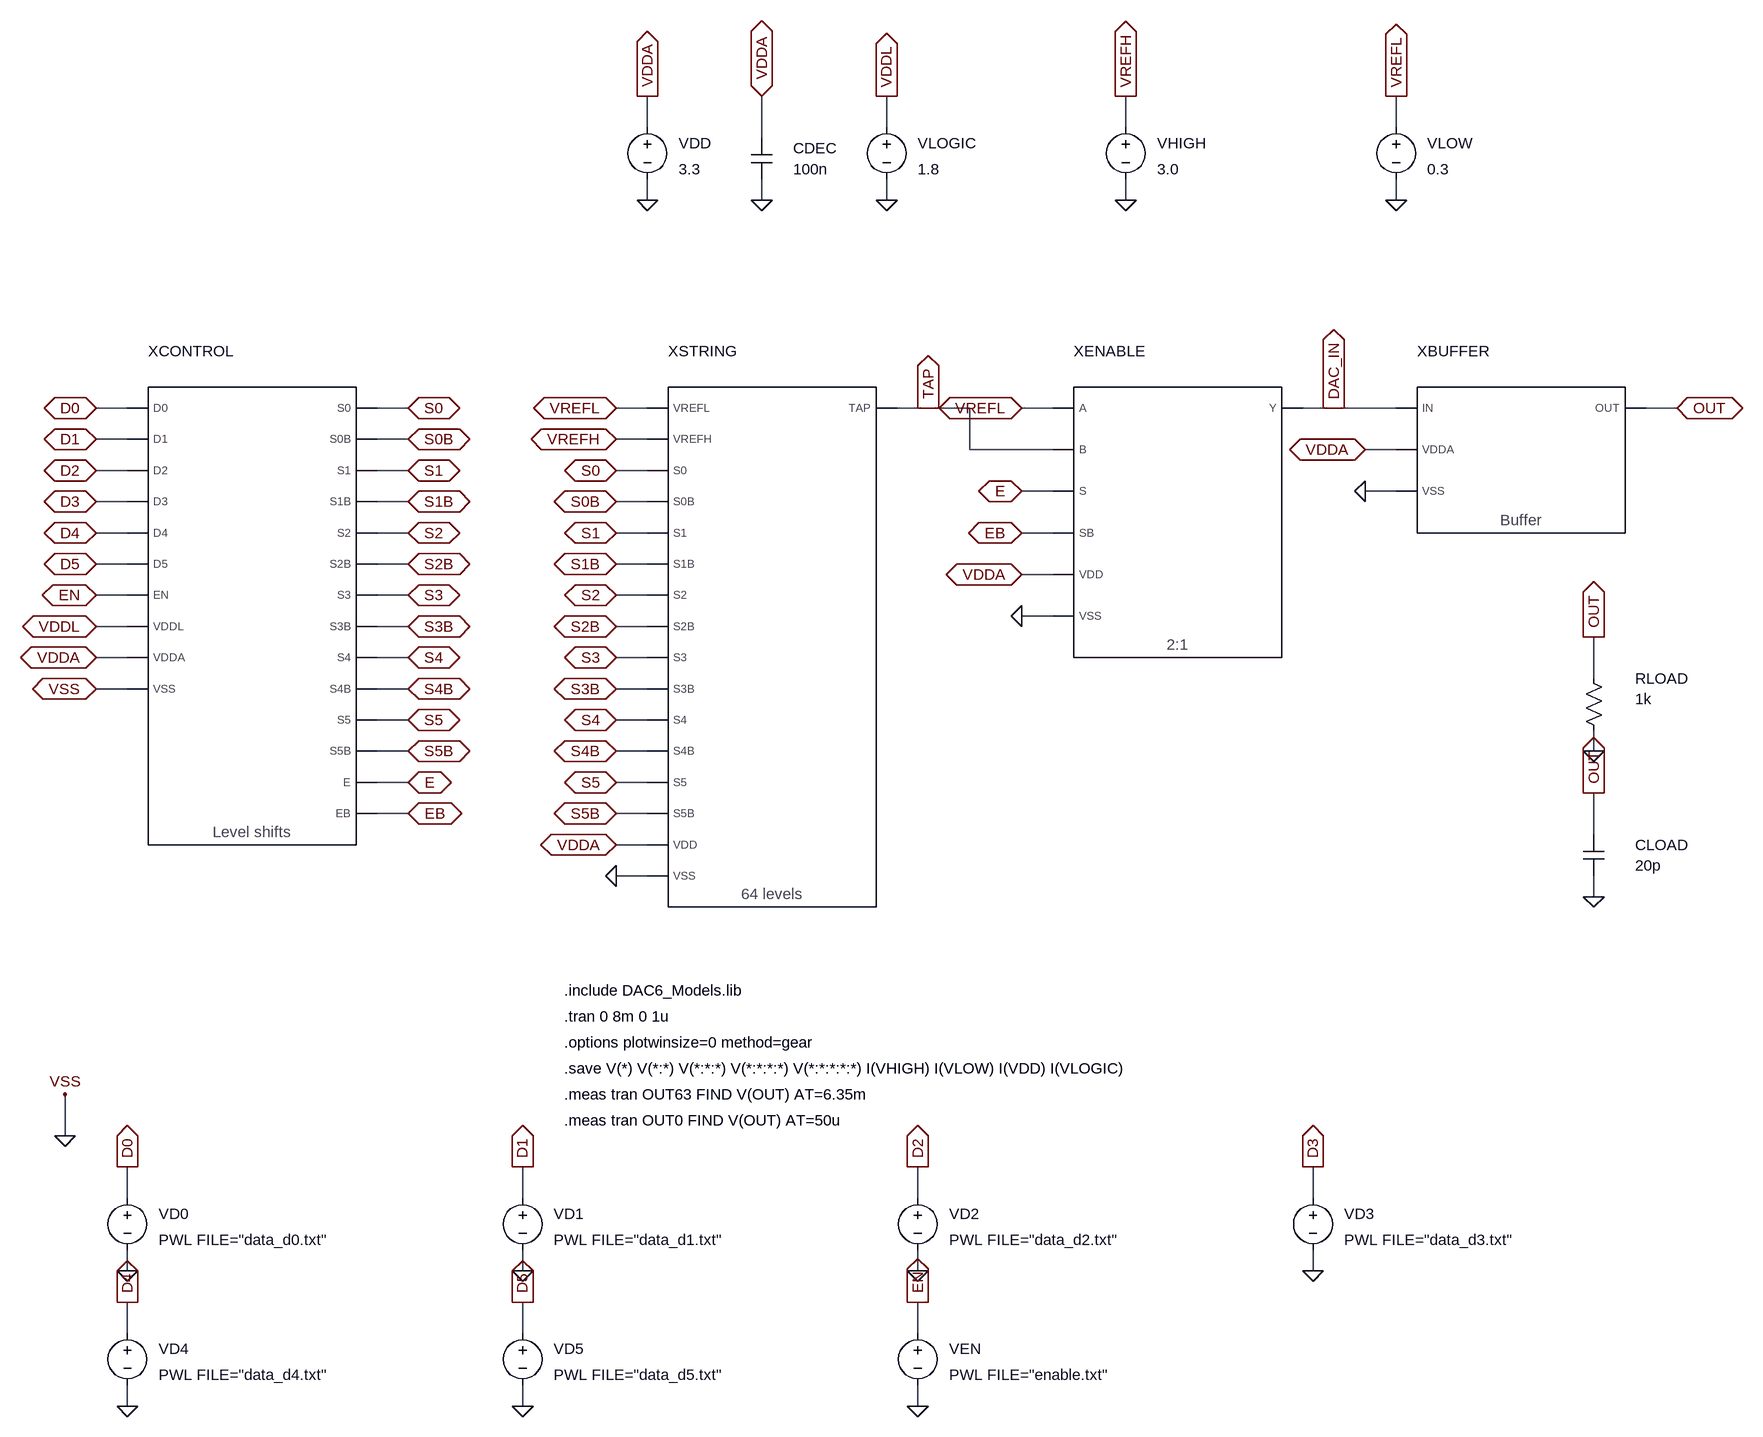
[diagram p0: schematic DAC6_Heavy_Load.asc]
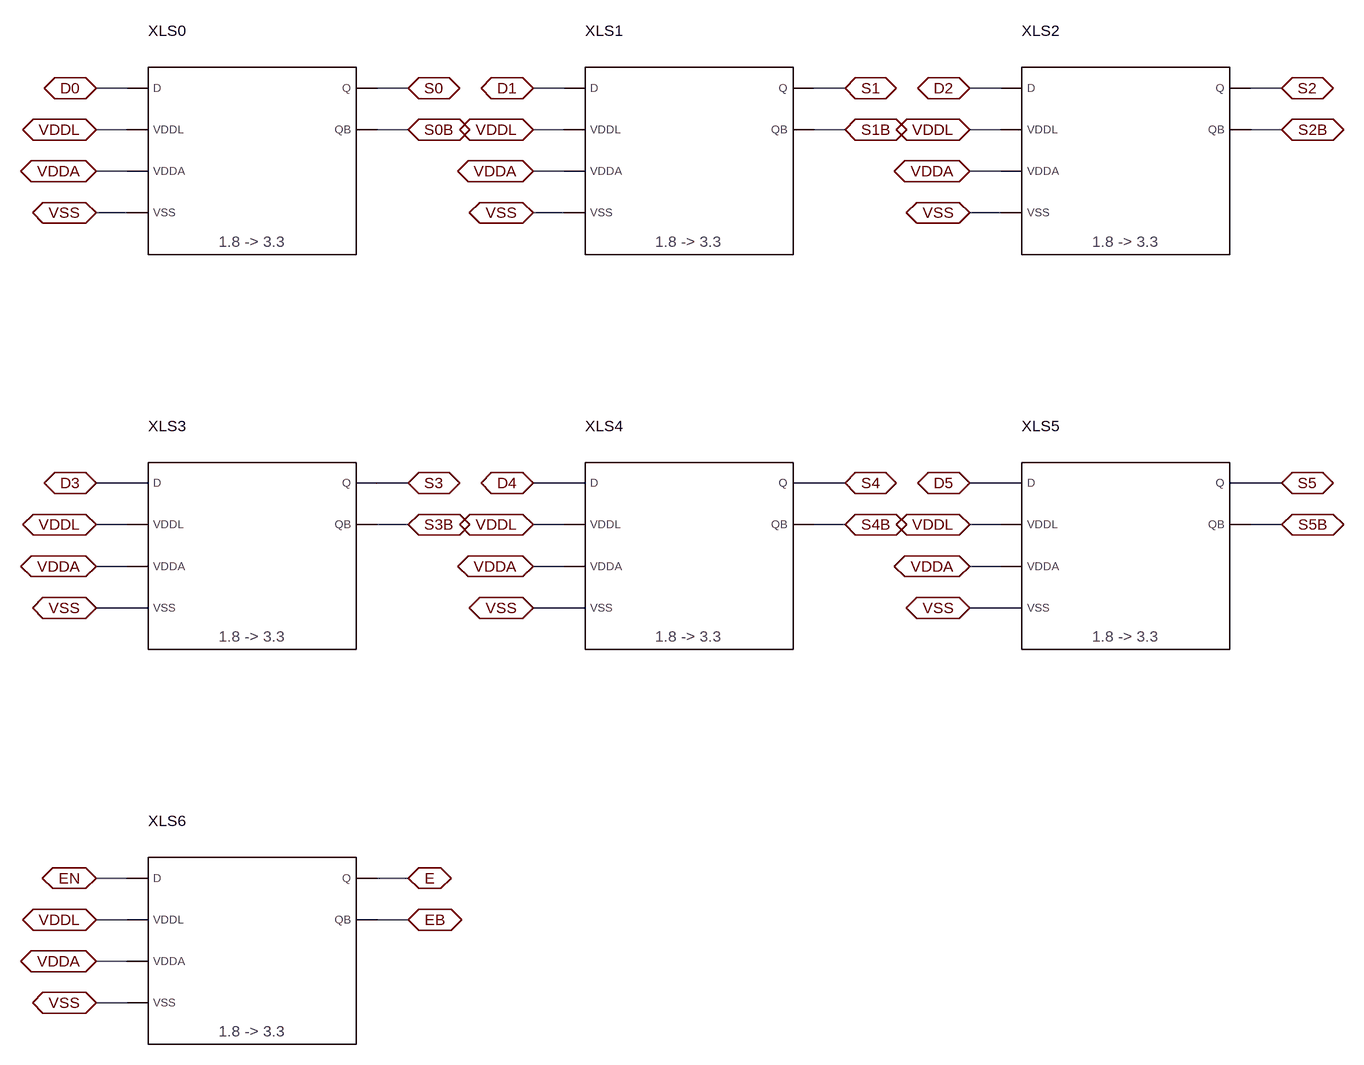
[diagram p1: sub-circuit dac_control.asc]
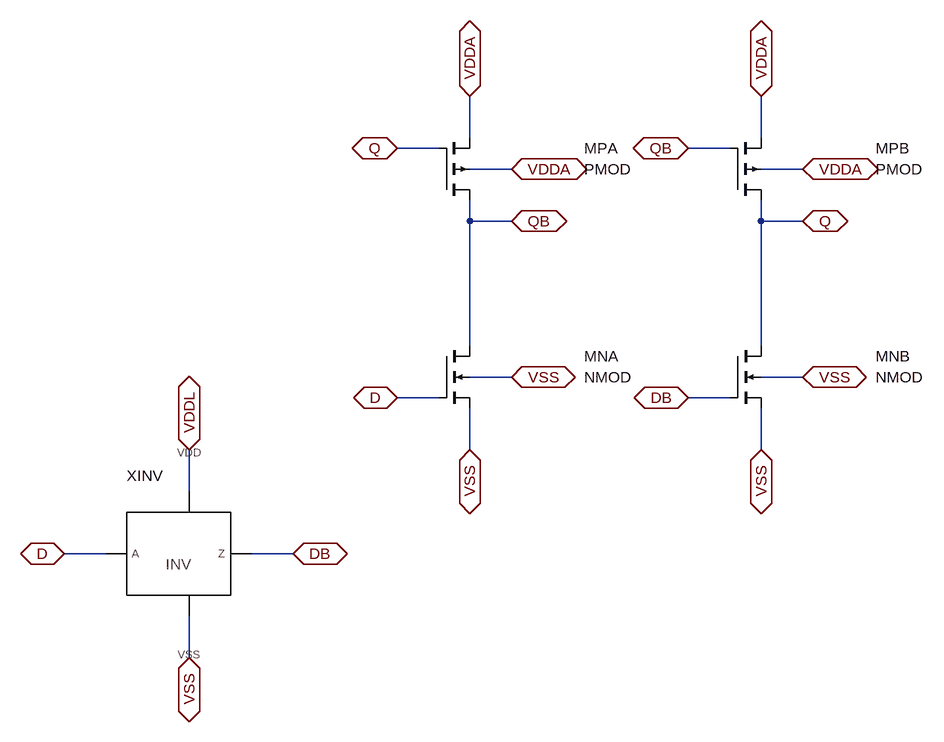
[diagram p2: sub-circuit dac_levelshift.asc]
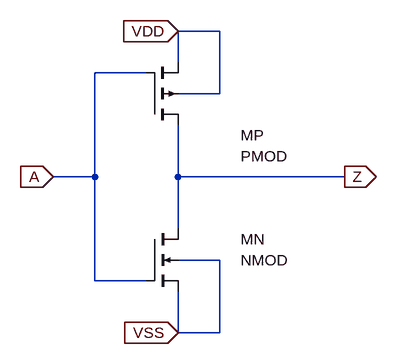
[diagram p3: sub-circuit cmos_inv.asc]
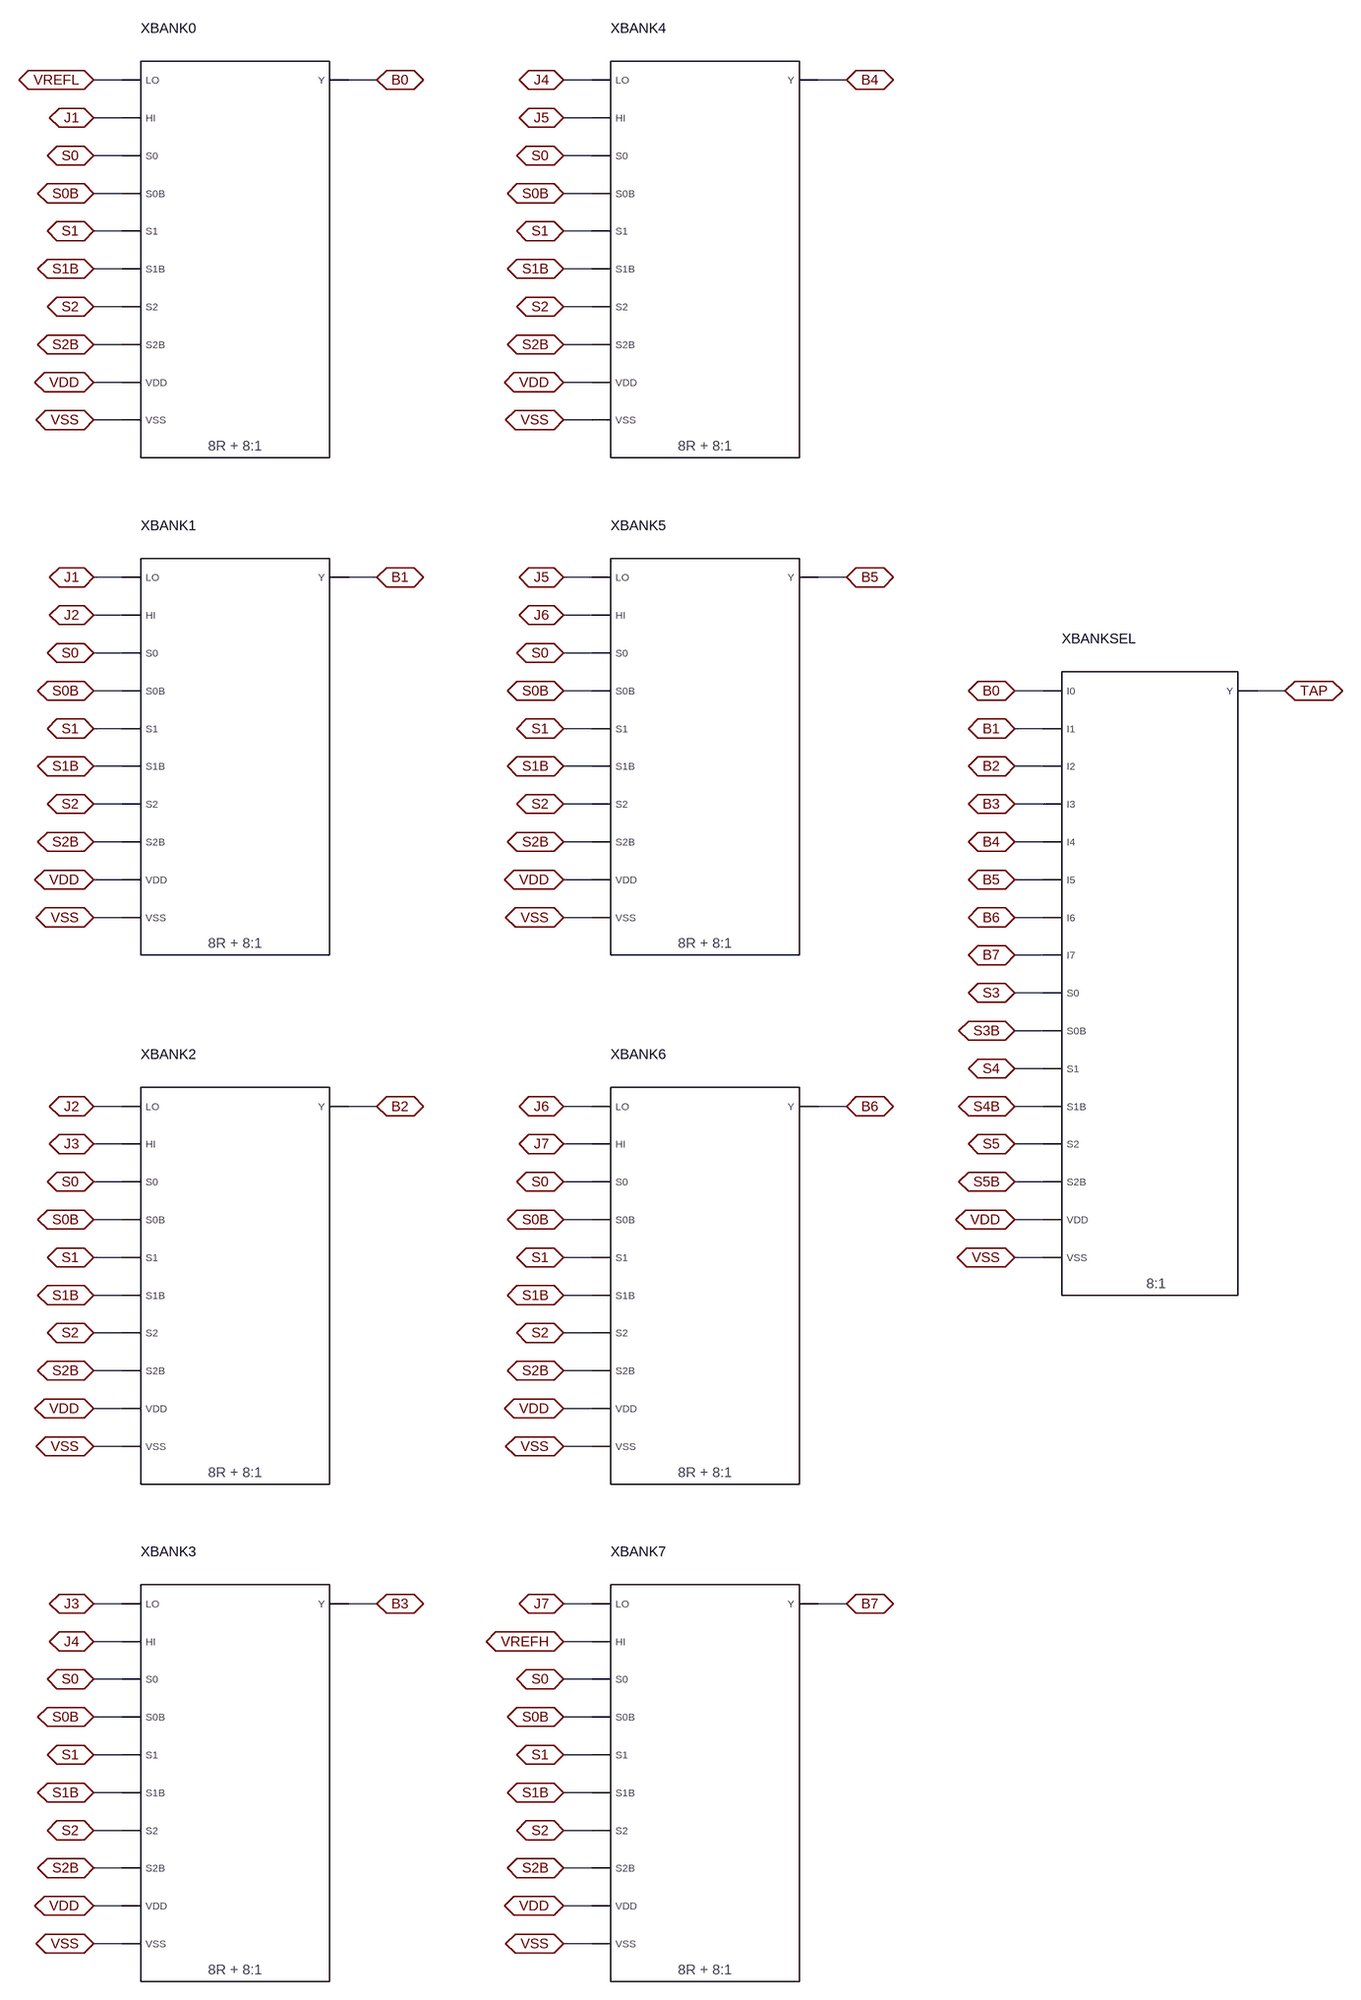
[diagram p4: sub-circuit dac_string64.asc]
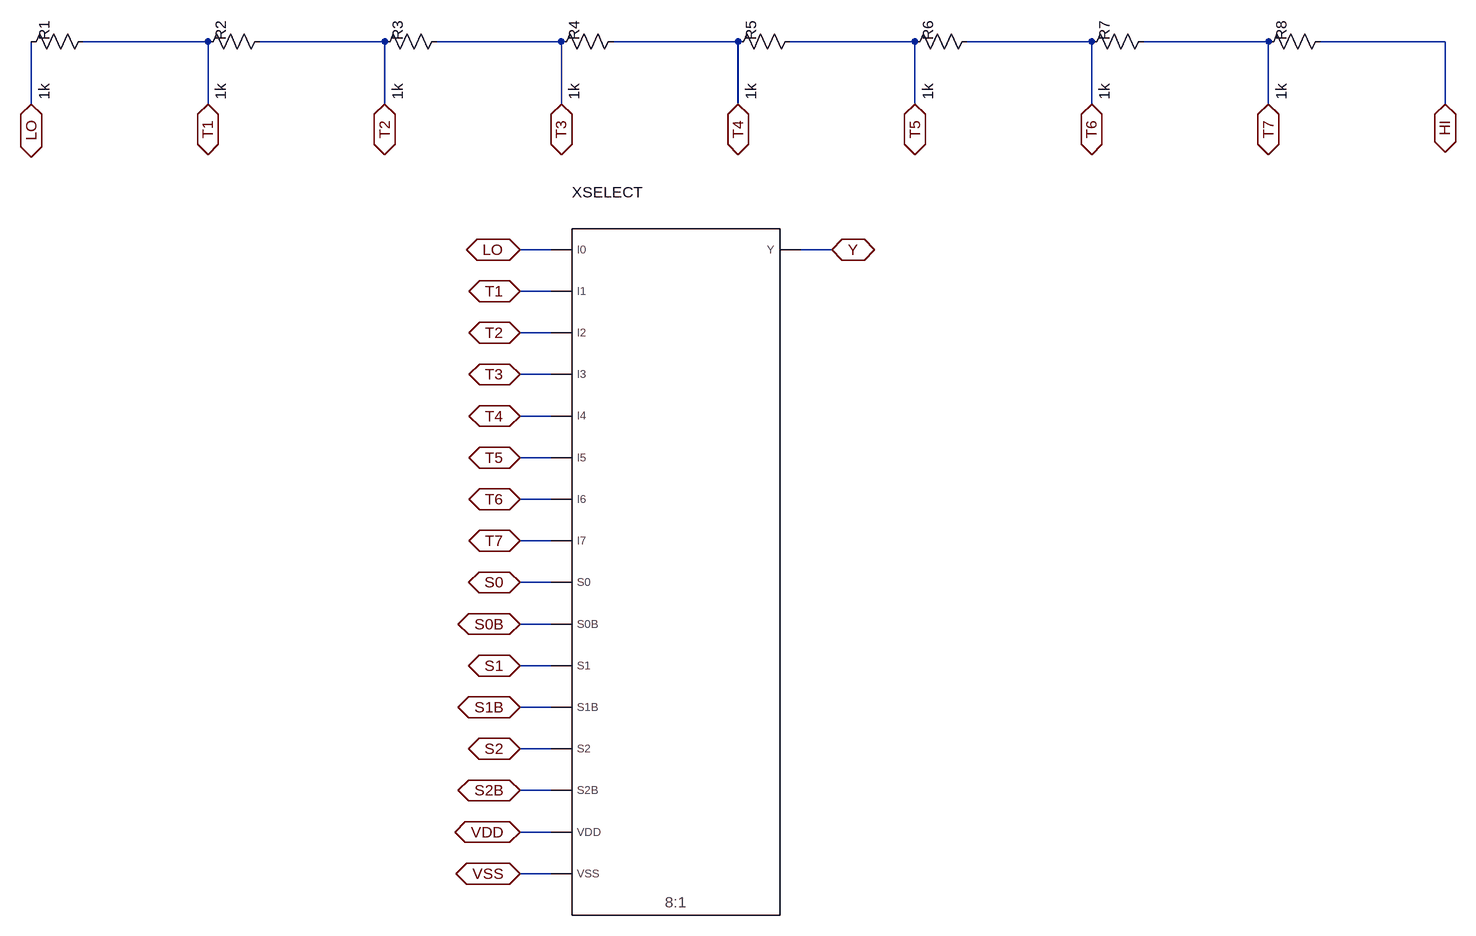
[diagram p5: sub-circuit dac_bank8.asc]
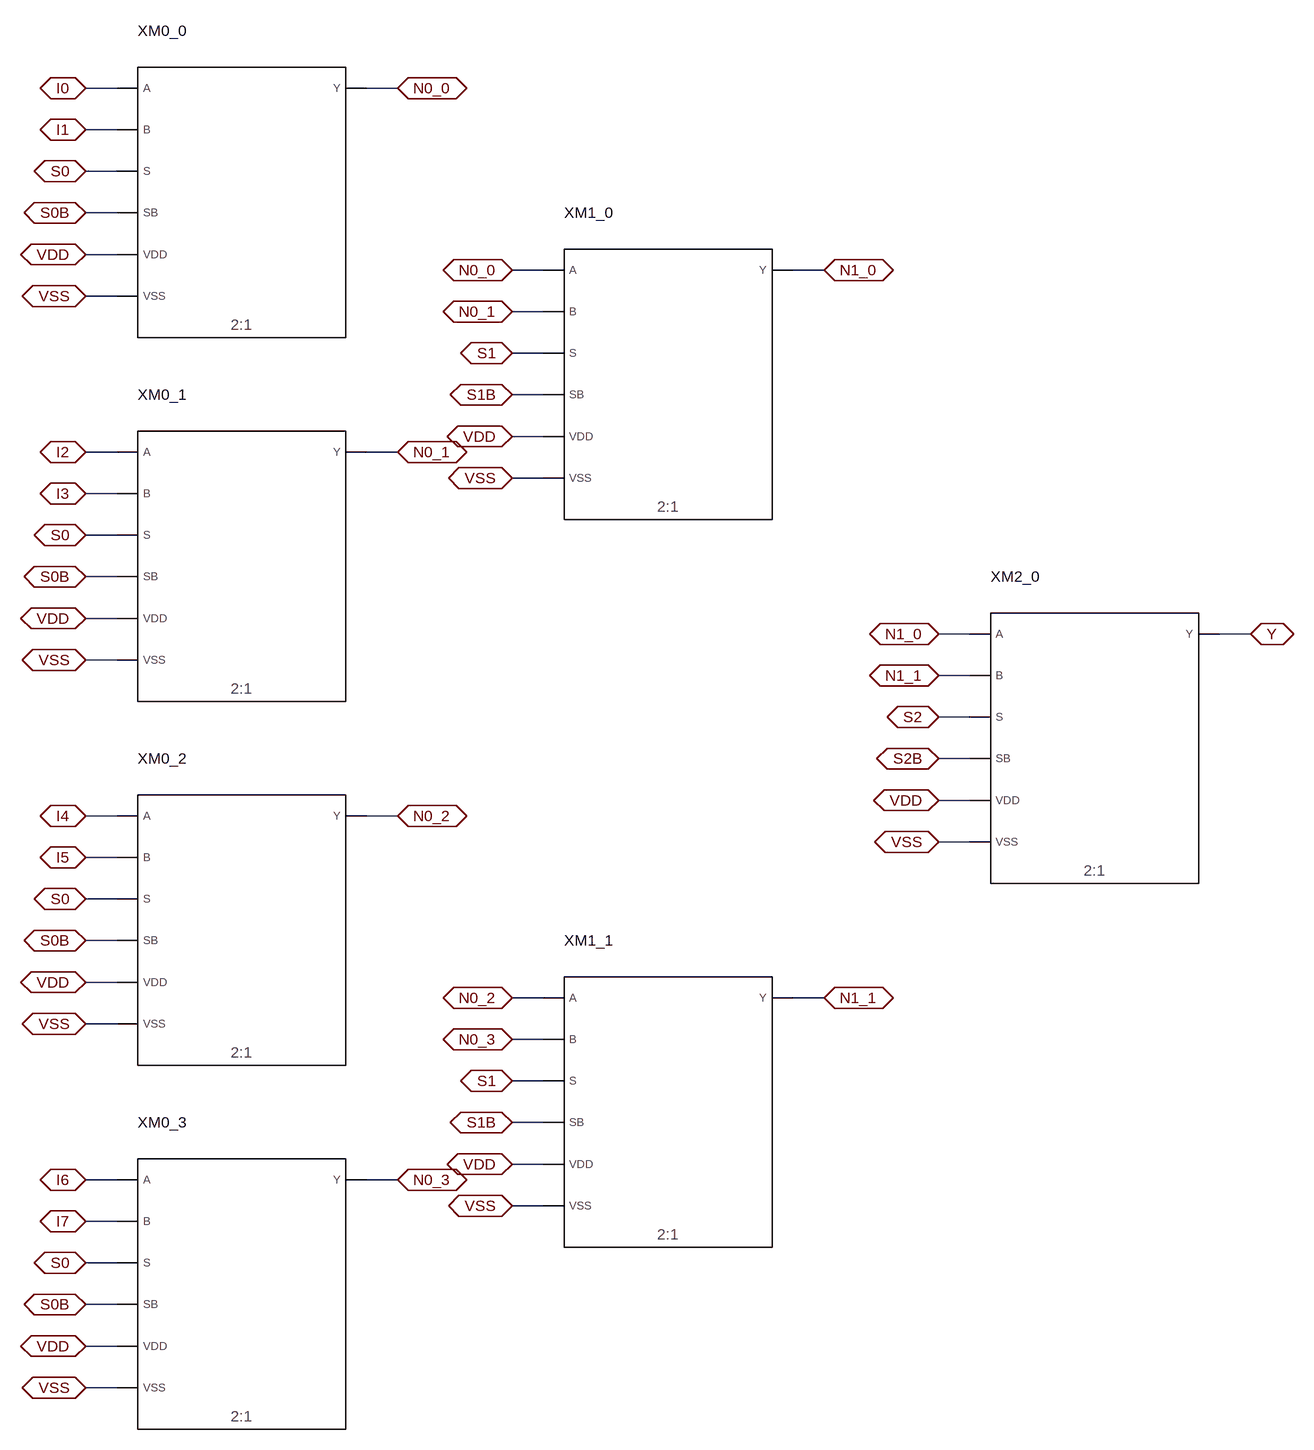
[diagram p6: sub-circuit dac_mux8.asc]
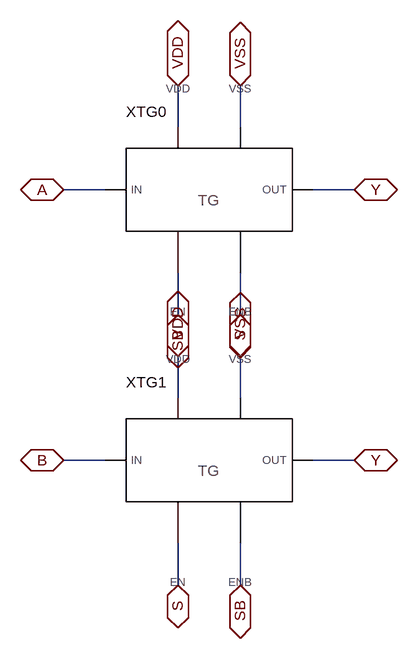
[diagram p7: sub-circuit dac_mux2.asc]
DAC6_Heavy_Load.asc, the LTspice schematic file:
Version 4.1
SHEET 1 2816 2256
WIRE 224 592 176 592
WIRE 224 640 176 640
WIRE 224 688 176 688
WIRE 224 736 176 736
WIRE 224 784 176 784
WIRE 224 832 176 832
WIRE 224 880 176 880
WIRE 224 928 176 928
WIRE 224 976 176 976
WIRE 224 1024 176 1024
WIRE 608 592 656 592
WIRE 608 640 656 640
WIRE 608 688 656 688
WIRE 608 736 656 736
WIRE 608 784 656 784
WIRE 608 832 656 832
WIRE 608 880 656 880
WIRE 608 928 656 928
WIRE 608 976 656 976
WIRE 608 1024 656 1024
WIRE 608 1072 656 1072
WIRE 608 1120 656 1120
WIRE 608 1168 656 1168
WIRE 608 1216 656 1216
WIRE 1024 592 976 592
WIRE 1024 640 976 640
WIRE 1024 688 976 688
WIRE 1024 736 976 736
WIRE 1024 784 976 784
WIRE 1024 832 976 832
WIRE 1024 880 976 880
WIRE 1024 928 976 928
WIRE 1024 976 976 976
WIRE 1024 1024 976 1024
WIRE 1024 1072 976 1072
WIRE 1024 1120 976 1120
WIRE 1024 1168 976 1168
WIRE 1024 1216 976 1216
WIRE 1024 1264 976 1264
WIRE 1024 1312 976 1312
WIRE 128 1648 128 1712
WIRE 1648 592 1600 592
WIRE 1648 720 1600 720
WIRE 1648 784 1600 784
WIRE 1648 848 1600 848
WIRE 1648 912 1600 912
WIRE 2176 656 2128 656
WIRE 2176 720 2128 720
WIRE 2560 592 2608 592
WIRE 1408 592 1520 592
WIRE 1520 592 1520 656
WIRE 1520 656 1648 656
WIRE 2032 592 2176 592
WIRE 1024 160 1024 112
WIRE 1024 240 1024 272
WIRE 1392 160 1392 112
WIRE 1392 240 1392 272
WIRE 1760 160 1760 112
WIRE 1760 240 1760 272
WIRE 2176 160 2176 112
WIRE 2176 240 2176 272
WIRE 1200 176 1200 112
WIRE 1200 240 1200 272
WIRE 224 1808 224 1760
WIRE 224 1888 224 1920
WIRE 832 1808 832 1760
WIRE 832 1888 832 1920
WIRE 1440 1808 1440 1760
WIRE 1440 1888 1440 1920
WIRE 2048 1808 2048 1760
WIRE 2048 1888 2048 1920
WIRE 224 2016 224 1968
WIRE 224 2096 224 2128
WIRE 832 2016 832 1968
WIRE 832 2096 832 2128
WIRE 1440 2016 1440 1968
WIRE 1440 2096 1440 2128
WIRE 2480 1008 2480 944
WIRE 2480 1088 2480 1120
WIRE 2480 1248 2480 1184
WIRE 2480 1312 2480 1344
FLAG 176 592 D0
IOPIN 176 592 BiDir
FLAG 176 640 D1
IOPIN 176 640 BiDir
FLAG 176 688 D2
IOPIN 176 688 BiDir
FLAG 176 736 D3
IOPIN 176 736 BiDir
FLAG 176 784 D4
IOPIN 176 784 BiDir
FLAG 176 832 D5
IOPIN 176 832 BiDir
FLAG 176 880 EN
IOPIN 176 880 BiDir
FLAG 176 928 VDDL
IOPIN 176 928 BiDir
FLAG 176 976 VDDA
IOPIN 176 976 BiDir
FLAG 176 1024 VSS
IOPIN 176 1024 BiDir
FLAG 656 592 S0
IOPIN 656 592 BiDir
FLAG 656 640 S0B
IOPIN 656 640 BiDir
FLAG 656 688 S1
IOPIN 656 688 BiDir
FLAG 656 736 S1B
IOPIN 656 736 BiDir
FLAG 656 784 S2
IOPIN 656 784 BiDir
FLAG 656 832 S2B
IOPIN 656 832 BiDir
FLAG 656 880 S3
IOPIN 656 880 BiDir
FLAG 656 928 S3B
IOPIN 656 928 BiDir
FLAG 656 976 S4
IOPIN 656 976 BiDir
FLAG 656 1024 S4B
IOPIN 656 1024 BiDir
FLAG 656 1072 S5
IOPIN 656 1072 BiDir
FLAG 656 1120 S5B
IOPIN 656 1120 BiDir
FLAG 656 1168 E
IOPIN 656 1168 BiDir
FLAG 656 1216 EB
IOPIN 656 1216 BiDir
FLAG 976 592 VREFL
IOPIN 976 592 BiDir
FLAG 976 640 VREFH
IOPIN 976 640 BiDir
FLAG 976 688 S0
IOPIN 976 688 BiDir
FLAG 976 736 S0B
IOPIN 976 736 BiDir
FLAG 976 784 S1
IOPIN 976 784 BiDir
FLAG 976 832 S1B
IOPIN 976 832 BiDir
FLAG 976 880 S2
IOPIN 976 880 BiDir
FLAG 976 928 S2B
IOPIN 976 928 BiDir
FLAG 976 976 S3
IOPIN 976 976 BiDir
FLAG 976 1024 S3B
IOPIN 976 1024 BiDir
FLAG 976 1072 S4
IOPIN 976 1072 BiDir
FLAG 976 1120 S4B
IOPIN 976 1120 BiDir
FLAG 976 1168 S5
IOPIN 976 1168 BiDir
FLAG 976 1216 S5B
IOPIN 976 1216 BiDir
FLAG 976 1264 VDDA
IOPIN 976 1264 BiDir
FLAG 976 1312 0
FLAG 128 1648 VSS
FLAG 128 1712 0
FLAG 1600 592 VREFL
IOPIN 1600 592 BiDir
FLAG 1600 720 E
IOPIN 1600 720 BiDir
FLAG 1600 784 EB
IOPIN 1600 784 BiDir
FLAG 1600 848 VDDA
IOPIN 1600 848 BiDir
FLAG 1600 912 0
FLAG 2128 656 VDDA
IOPIN 2128 656 BiDir
FLAG 2128 720 0
FLAG 2608 592 OUT
IOPIN 2608 592 BiDir
FLAG 1456 592 TAP
IOPIN 1456 592 Out
FLAG 2080 592 DAC_IN
IOPIN 2080 592 Out
FLAG 1024 112 VDDA
IOPIN 1024 112 Out
FLAG 1024 272 0
FLAG 1392 112 VDDL
IOPIN 1392 112 Out
FLAG 1392 272 0
FLAG 1760 112 VREFH
IOPIN 1760 112 Out
FLAG 1760 272 0
FLAG 2176 112 VREFL
IOPIN 2176 112 Out
FLAG 2176 272 0
FLAG 1200 112 VDDA
IOPIN 1200 112 BiDir
FLAG 1200 272 0
FLAG 224 1760 D0
IOPIN 224 1760 Out
FLAG 224 1920 0
FLAG 832 1760 D1
IOPIN 832 1760 Out
FLAG 832 1920 0
FLAG 1440 1760 D2
IOPIN 1440 1760 Out
FLAG 1440 1920 0
FLAG 2048 1760 D3
IOPIN 2048 1760 Out
FLAG 2048 1920 0
FLAG 224 1968 D4
IOPIN 224 1968 Out
FLAG 224 2128 0
FLAG 832 1968 D5
IOPIN 832 1968 Out
FLAG 832 2128 0
FLAG 1440 1968 EN
IOPIN 1440 1968 Out
FLAG 1440 2128 0
FLAG 2480 944 OUT
IOPIN 2480 944 Out
FLAG 2480 1120 0
FLAG 2480 1184 OUT
IOPIN 2480 1184 Out
FLAG 2480 1344 0
SYMBOL DAC_Control 224 528 R0
WINDOW 0 32 -24 Left 2
SYMATTR InstName XCONTROL
SYMBOL DAC_String64 1024 528 R0
WINDOW 0 32 -24 Left 2
SYMATTR InstName XSTRING
SYMBOL DAC_Mux2 1648 528 R0
WINDOW 0 32 -24 Left 2
SYMATTR InstName XENABLE
SYMBOL DAC_Buffer 2176 528 R0
WINDOW 0 32 -24 Left 2
SYMATTR InstName XBUFFER
SYMBOL voltage 1024 144 R0
WINDOW 0 48 40 Left 2
WINDOW 3 48 80 Left 2
SYMATTR InstName VDD
SYMATTR Value 3.3
SYMBOL voltage 1392 144 R0
WINDOW 0 48 40 Left 2
WINDOW 3 48 80 Left 2
SYMATTR InstName VLOGIC
SYMATTR Value 1.8
SYMBOL voltage 1760 144 R0
WINDOW 0 48 40 Left 2
WINDOW 3 48 80 Left 2
SYMATTR InstName VHIGH
SYMATTR Value 3.0
SYMBOL voltage 2176 144 R0
WINDOW 0 48 40 Left 2
WINDOW 3 48 80 Left 2
SYMATTR InstName VLOW
SYMATTR Value 0.3
SYMBOL cap 1184 176 R0
WINDOW 0 64 16 Left 2
WINDOW 3 64 48 Left 2
SYMATTR InstName CDEC
SYMATTR Value 100n
SYMBOL voltage 224 1792 R0
WINDOW 0 48 40 Left 2
WINDOW 3 48 80 Left 2
SYMATTR InstName VD0
SYMATTR Value PWL FILE="data_d0.txt"
SYMBOL voltage 832 1792 R0
WINDOW 0 48 40 Left 2
WINDOW 3 48 80 Left 2
SYMATTR InstName VD1
SYMATTR Value PWL FILE="data_d1.txt"
SYMBOL voltage 1440 1792 R0
WINDOW 0 48 40 Left 2
WINDOW 3 48 80 Left 2
SYMATTR InstName VD2
SYMATTR Value PWL FILE="data_d2.txt"
SYMBOL voltage 2048 1792 R0
WINDOW 0 48 40 Left 2
WINDOW 3 48 80 Left 2
SYMATTR InstName VD3
SYMATTR Value PWL FILE="data_d3.txt"
SYMBOL voltage 224 2000 R0
WINDOW 0 48 40 Left 2
WINDOW 3 48 80 Left 2
SYMATTR InstName VD4
SYMATTR Value PWL FILE="data_d4.txt"
SYMBOL voltage 832 2000 R0
WINDOW 0 48 40 Left 2
WINDOW 3 48 80 Left 2
SYMATTR InstName VD5
SYMATTR Value PWL FILE="data_d5.txt"
SYMBOL voltage 1440 2000 R0
WINDOW 0 48 40 Left 2
WINDOW 3 48 80 Left 2
SYMATTR InstName VEN
SYMATTR Value PWL FILE="enable.txt"
SYMBOL res 2464 992 R0
WINDOW 0 80 16 Left 2
WINDOW 3 80 48 Left 2
SYMATTR InstName RLOAD
SYMATTR Value 1k
SYMBOL cap 2464 1248 R0
WINDOW 0 80 16 Left 2
WINDOW 3 80 48 Left 2
SYMATTR InstName CLOAD
SYMATTR Value 20p
TEXT 896 1488 Left 2 !.include DAC6_Models.lib
TEXT 896 1528 Left 2 !.tran 0 8m 0 1u
TEXT 896 1568 Left 2 !.options plotwinsize=0 method=gear
TEXT 896 1608 Left 2 !.save V(*) V(*:*) V(*:*:*) V(*:*:*:*) V(*:*:*:*:*) I(VHIGH) I(VLOW) I(VDD) I(VLOGIC)
TEXT 896 1648 Left 2 !.meas tran OUT63 FIND V(OUT) AT=6.35m
TEXT 896 1688 Left 2 !.meas tran OUT0 FIND V(OUT) AT=50u

dac_control.asc, the sub-circuit schematic file:
Version 4.1
SHEET 1 2208 1952
WIRE 192 160 144 160
WIRE 192 224 144 224
WIRE 192 288 144 288
WIRE 192 352 144 352
WIRE 576 160 624 160
WIRE 576 224 624 224
WIRE 864 160 816 160
WIRE 864 224 816 224
WIRE 864 288 816 288
WIRE 864 352 816 352
WIRE 1248 160 1296 160
WIRE 1248 224 1296 224
WIRE 1536 160 1488 160
WIRE 1536 224 1488 224
WIRE 1536 288 1488 288
WIRE 1536 352 1488 352
WIRE 1920 160 1968 160
WIRE 1920 224 1968 224
WIRE 192 768 144 768
WIRE 192 832 144 832
WIRE 192 896 144 896
WIRE 192 960 144 960
WIRE 576 768 624 768
WIRE 576 832 624 832
WIRE 864 768 816 768
WIRE 864 832 816 832
WIRE 864 896 816 896
WIRE 864 960 816 960
WIRE 1248 768 1296 768
WIRE 1248 832 1296 832
WIRE 1536 768 1488 768
WIRE 1536 832 1488 832
WIRE 1536 896 1488 896
WIRE 1536 960 1488 960
WIRE 1920 768 1968 768
WIRE 1920 832 1968 832
WIRE 192 1376 144 1376
WIRE 192 1440 144 1440
WIRE 192 1504 144 1504
WIRE 192 1568 144 1568
WIRE 576 1376 624 1376
WIRE 576 1440 624 1440
FLAG 144 160 D0
IOPIN 144 160 BiDir
FLAG 144 224 VDDL
IOPIN 144 224 BiDir
FLAG 144 288 VDDA
IOPIN 144 288 BiDir
FLAG 144 352 VSS
IOPIN 144 352 BiDir
FLAG 624 160 S0
IOPIN 624 160 BiDir
FLAG 624 224 S0B
IOPIN 624 224 BiDir
FLAG 816 160 D1
IOPIN 816 160 BiDir
FLAG 816 224 VDDL
IOPIN 816 224 BiDir
FLAG 816 288 VDDA
IOPIN 816 288 BiDir
FLAG 816 352 VSS
IOPIN 816 352 BiDir
FLAG 1296 160 S1
IOPIN 1296 160 BiDir
FLAG 1296 224 S1B
IOPIN 1296 224 BiDir
FLAG 1488 160 D2
IOPIN 1488 160 BiDir
FLAG 1488 224 VDDL
IOPIN 1488 224 BiDir
FLAG 1488 288 VDDA
IOPIN 1488 288 BiDir
FLAG 1488 352 VSS
IOPIN 1488 352 BiDir
FLAG 1968 160 S2
IOPIN 1968 160 BiDir
FLAG 1968 224 S2B
IOPIN 1968 224 BiDir
FLAG 144 768 D3
IOPIN 144 768 BiDir
FLAG 144 832 VDDL
IOPIN 144 832 BiDir
FLAG 144 896 VDDA
IOPIN 144 896 BiDir
FLAG 144 960 VSS
IOPIN 144 960 BiDir
FLAG 624 768 S3
IOPIN 624 768 BiDir
FLAG 624 832 S3B
IOPIN 624 832 BiDir
FLAG 816 768 D4
IOPIN 816 768 BiDir
FLAG 816 832 VDDL
IOPIN 816 832 BiDir
FLAG 816 896 VDDA
IOPIN 816 896 BiDir
FLAG 816 960 VSS
IOPIN 816 960 BiDir
FLAG 1296 768 S4
IOPIN 1296 768 BiDir
FLAG 1296 832 S4B
IOPIN 1296 832 BiDir
FLAG 1488 768 D5
IOPIN 1488 768 BiDir
FLAG 1488 832 VDDL
IOPIN 1488 832 BiDir
FLAG 1488 896 VDDA
IOPIN 1488 896 BiDir
FLAG 1488 960 VSS
IOPIN 1488 960 BiDir
FLAG 1968 768 S5
IOPIN 1968 768 BiDir
FLAG 1968 832 S5B
IOPIN 1968 832 BiDir
FLAG 144 1376 EN
IOPIN 144 1376 BiDir
FLAG 144 1440 VDDL
IOPIN 144 1440 BiDir
FLAG 144 1504 VDDA
IOPIN 144 1504 BiDir
FLAG 144 1568 VSS
IOPIN 144 1568 BiDir
FLAG 624 1376 E
IOPIN 624 1376 BiDir
FLAG 624 1440 EB
IOPIN 624 1440 BiDir
SYMBOL DAC_LevelShift 192 96 R0
WINDOW 0 32 -24 Left 2
SYMATTR InstName XLS0
SYMBOL DAC_LevelShift 864 96 R0
WINDOW 0 32 -24 Left 2
SYMATTR InstName XLS1
SYMBOL DAC_LevelShift 1536 96 R0
WINDOW 0 32 -24 Left 2
SYMATTR InstName XLS2
SYMBOL DAC_LevelShift 192 704 R0
WINDOW 0 32 -24 Left 2
SYMATTR InstName XLS3
SYMBOL DAC_LevelShift 864 704 R0
WINDOW 0 32 -24 Left 2
SYMATTR InstName XLS4
SYMBOL DAC_LevelShift 1536 704 R0
WINDOW 0 32 -24 Left 2
SYMATTR InstName XLS5
SYMBOL DAC_LevelShift 192 1312 R0
WINDOW 0 32 -24 Left 2
SYMATTR InstName XLS6

dac_levelshift.asc, the sub-circuit schematic file:
Version 4.1
SHEET 1 1632 1136
WIRE 192 832 128 832
WIRE 416 832 480 832
WIRE 320 736 320 672
WIRE 320 928 320 992
WIRE 752 192 752 128
WIRE 752 240 816 240
WIRE 704 208 640 208
WIRE 752 288 752 336
WIRE 752 320 816 320
WIRE 752 336 752 512
WIRE 704 592 640 592
WIRE 752 560 816 560
WIRE 752 608 752 672
WIRE 1200 192 1200 128
WIRE 1200 240 1264 240
WIRE 1152 208 1088 208
WIRE 1200 288 1200 336
WIRE 1200 320 1264 320
WIRE 1200 336 1200 512
WIRE 1152 592 1088 592
WIRE 1200 560 1264 560
WIRE 1200 608 1200 672
FLAG 128 832 D
IOPIN 128 832 BiDir
FLAG 480 832 DB
IOPIN 480 832 BiDir
FLAG 320 672 VDDL
IOPIN 320 672 BiDir
FLAG 320 992 VSS
IOPIN 320 992 BiDir
FLAG 752 128 VDDA
IOPIN 752 128 BiDir
FLAG 816 240 VDDA
IOPIN 816 240 BiDir
FLAG 640 208 Q
IOPIN 640 208 BiDir
FLAG 816 320 QB
IOPIN 816 320 BiDir
FLAG 640 592 D
IOPIN 640 592 BiDir
FLAG 816 560 VSS
IOPIN 816 560 BiDir
FLAG 752 672 VSS
IOPIN 752 672 BiDir
FLAG 1200 128 VDDA
IOPIN 1200 128 BiDir
FLAG 1264 240 VDDA
IOPIN 1264 240 BiDir
FLAG 1088 208 QB
IOPIN 1088 208 BiDir
FLAG 1264 320 Q
IOPIN 1264 320 BiDir
FLAG 1088 592 DB
IOPIN 1088 592 BiDir
FLAG 1264 560 VSS
IOPIN 1264 560 BiDir
FLAG 1200 672 VSS
IOPIN 1200 672 BiDir
SYMBOL CMOS_INV 192 736 R0
WINDOW 0 32 -24 Left 2
SYMATTR InstName XINV
SYMBOL pmos4 704 288 M180
WINDOW 0 224 80 Left 2
WINDOW 3 224 48 Left 2
SYMATTR InstName MPA
SYMATTR Value PMOD
SYMATTR SpiceLine W=4u L=1u
SYMBOL nmos4 704 512 R0
WINDOW 0 224 16 Left 2
WINDOW 3 224 48 Left 2
SYMATTR InstName MNA
SYMATTR Value NMOD
SYMATTR SpiceLine W=40u L=1u
SYMBOL pmos4 1152 288 M180
WINDOW 0 224 80 Left 2
WINDOW 3 224 48 Left 2
SYMATTR InstName MPB
SYMATTR Value PMOD
SYMATTR SpiceLine W=4u L=1u
SYMBOL nmos4 1152 512 R0
WINDOW 0 224 16 Left 2
WINDOW 3 224 48 Left 2
SYMATTR InstName MNB
SYMATTR Value NMOD
SYMATTR SpiceLine W=40u L=1u

cmos_inv.asc, the sub-circuit schematic file:
Version 4.1
SHEET 1 800 640
WIRE 352 192 352 272
WIRE 352 272 352 352
WIRE 352 272 608 272
WIRE 304 112 224 112
WIRE 224 112 224 272
WIRE 224 272 224 432
WIRE 224 432 304 432
WIRE 224 272 160 272
WIRE 352 96 352 48
WIRE 352 144 416 144
WIRE 416 144 416 48
WIRE 416 48 352 48
WIRE 352 448 352 512
WIRE 352 400 416 400
WIRE 416 400 416 512
WIRE 416 512 352 512
FLAG 608 272 Z
IOPIN 608 272 Out
FLAG 160 272 A
IOPIN 160 272 In
FLAG 352 48 VDD
IOPIN 352 48 In
FLAG 352 512 VSS
IOPIN 352 512 In
SYMBOL pmos4 304 192 M180
WINDOW 0 144 -16 Left 2
WINDOW 3 144 -48 Left 2
SYMATTR InstName MP
SYMATTR Value PMOD
SYMATTR SpiceLine W=20u L=1u
SYMBOL nmos4 304 352 R0
WINDOW 0 144 16 Left 2
WINDOW 3 144 48 Left 2
SYMATTR InstName MN
SYMATTR Value NMOD
SYMATTR SpiceLine W=10u L=1u

dac_string64.asc, the sub-circuit schematic file:
Version 4.1
SHEET 1 2816 3824
WIRE 192 160 144 160
WIRE 192 224 144 224
WIRE 192 288 144 288
WIRE 192 352 144 352
WIRE 192 416 144 416
WIRE 192 480 144 480
WIRE 192 544 144 544
WIRE 192 608 144 608
WIRE 192 672 144 672
WIRE 192 736 144 736
WIRE 576 160 624 160
WIRE 192 1056 144 1056
WIRE 192 1120 144 1120
WIRE 192 1184 144 1184
WIRE 192 1248 144 1248
WIRE 192 1312 144 1312
WIRE 192 1376 144 1376
WIRE 192 1440 144 1440
WIRE 192 1504 144 1504
WIRE 192 1568 144 1568
WIRE 192 1632 144 1632
WIRE 576 1056 624 1056
WIRE 192 1952 144 1952
WIRE 192 2016 144 2016
WIRE 192 2080 144 2080
WIRE 192 2144 144 2144
WIRE 192 2208 144 2208
WIRE 192 2272 144 2272
WIRE 192 2336 144 2336
WIRE 192 2400 144 2400
WIRE 192 2464 144 2464
WIRE 192 2528 144 2528
WIRE 576 1952 624 1952
WIRE 192 2848 144 2848
WIRE 192 2912 144 2912
WIRE 192 2976 144 2976
WIRE 192 3040 144 3040
WIRE 192 3104 144 3104
WIRE 192 3168 144 3168
WIRE 192 3232 144 3232
WIRE 192 3296 144 3296
WIRE 192 3360 144 3360
WIRE 192 3424 144 3424
WIRE 576 2848 624 2848
WIRE 1120 160 1072 160
WIRE 1120 224 1072 224
WIRE 1120 288 1072 288
WIRE 1120 352 1072 352
WIRE 1120 416 1072 416
WIRE 1120 480 1072 480
WIRE 1120 544 1072 544
WIRE 1120 608 1072 608
WIRE 1120 672 1072 672
WIRE 1120 736 1072 736
WIRE 1504 160 1552 160
WIRE 1120 1056 1072 1056
WIRE 1120 1120 1072 1120
WIRE 1120 1184 1072 1184
WIRE 1120 1248 1072 1248
WIRE 1120 1312 1072 1312
WIRE 1120 1376 1072 1376
WIRE 1120 1440 1072 1440
WIRE 1120 1504 1072 1504
WIRE 1120 1568 1072 1568
WIRE 1120 1632 1072 1632
WIRE 1504 1056 1552 1056
WIRE 1120 1952 1072 1952
WIRE 1120 2016 1072 2016
WIRE 1120 2080 1072 2080
WIRE 1120 2144 1072 2144
WIRE 1120 2208 1072 2208
WIRE 1120 2272 1072 2272
WIRE 1120 2336 1072 2336
WIRE 1120 2400 1072 2400
WIRE 1120 2464 1072 2464
WIRE 1120 2528 1072 2528
WIRE 1504 1952 1552 1952
WIRE 1120 2848 1072 2848
WIRE 1120 2912 1072 2912
WIRE 1120 2976 1072 2976
WIRE 1120 3040 1072 3040
WIRE 1120 3104 1072 3104
WIRE 1120 3168 1072 3168
WIRE 1120 3232 1072 3232
WIRE 1120 3296 1072 3296
WIRE 1120 3360 1072 3360
WIRE 1120 3424 1072 3424
WIRE 1504 2848 1552 2848
WIRE 2112 1248 2064 1248
WIRE 2112 1312 2064 1312
WIRE 2112 1376 2064 1376
WIRE 2112 1440 2064 1440
WIRE 2112 1504 2064 1504
WIRE 2112 1568 2064 1568
WIRE 2112 1632 2064 1632
WIRE 2112 1696 2064 1696
WIRE 2112 1760 2064 1760
WIRE 2112 1824 2064 1824
WIRE 2112 1888 2064 1888
WIRE 2112 1952 2064 1952
WIRE 2112 2016 2064 2016
WIRE 2112 2080 2064 2080
WIRE 2112 2144 2064 2144
WIRE 2112 2208 2064 2208
WIRE 2496 1248 2544 1248
FLAG 144 160 VREFL
IOPIN 144 160 BiDir
FLAG 144 224 J1
IOPIN 144 224 BiDir
FLAG 144 288 S0
IOPIN 144 288 BiDir
FLAG 144 352 S0B
IOPIN 144 352 BiDir
FLAG 144 416 S1
IOPIN 144 416 BiDir
FLAG 144 480 S1B
IOPIN 144 480 BiDir
FLAG 144 544 S2
IOPIN 144 544 BiDir
FLAG 144 608 S2B
IOPIN 144 608 BiDir
FLAG 144 672 VDD
IOPIN 144 672 BiDir
FLAG 144 736 VSS
IOPIN 144 736 BiDir
FLAG 624 160 B0
IOPIN 624 160 BiDir
FLAG 144 1056 J1
IOPIN 144 1056 BiDir
FLAG 144 1120 J2
IOPIN 144 1120 BiDir
FLAG 144 1184 S0
IOPIN 144 1184 BiDir
FLAG 144 1248 S0B
IOPIN 144 1248 BiDir
FLAG 144 1312 S1
IOPIN 144 1312 BiDir
FLAG 144 1376 S1B
IOPIN 144 1376 BiDir
FLAG 144 1440 S2
IOPIN 144 1440 BiDir
FLAG 144 1504 S2B
IOPIN 144 1504 BiDir
FLAG 144 1568 VDD
IOPIN 144 1568 BiDir
FLAG 144 1632 VSS
IOPIN 144 1632 BiDir
FLAG 624 1056 B1
IOPIN 624 1056 BiDir
FLAG 144 1952 J2
IOPIN 144 1952 BiDir
FLAG 144 2016 J3
IOPIN 144 2016 BiDir
FLAG 144 2080 S0
IOPIN 144 2080 BiDir
FLAG 144 2144 S0B
IOPIN 144 2144 BiDir
FLAG 144 2208 S1
IOPIN 144 2208 BiDir
FLAG 144 2272 S1B
IOPIN 144 2272 BiDir
FLAG 144 2336 S2
IOPIN 144 2336 BiDir
FLAG 144 2400 S2B
IOPIN 144 2400 BiDir
FLAG 144 2464 VDD
IOPIN 144 2464 BiDir
FLAG 144 2528 VSS
IOPIN 144 2528 BiDir
FLAG 624 1952 B2
IOPIN 624 1952 BiDir
FLAG 144 2848 J3
IOPIN 144 2848 BiDir
FLAG 144 2912 J4
IOPIN 144 2912 BiDir
FLAG 144 2976 S0
IOPIN 144 2976 BiDir
FLAG 144 3040 S0B
IOPIN 144 3040 BiDir
FLAG 144 3104 S1
IOPIN 144 3104 BiDir
FLAG 144 3168 S1B
IOPIN 144 3168 BiDir
FLAG 144 3232 S2
IOPIN 144 3232 BiDir
FLAG 144 3296 S2B
IOPIN 144 3296 BiDir
FLAG 144 3360 VDD
IOPIN 144 3360 BiDir
FLAG 144 3424 VSS
IOPIN 144 3424 BiDir
FLAG 624 2848 B3
IOPIN 624 2848 BiDir
FLAG 1072 160 J4
IOPIN 1072 160 BiDir
FLAG 1072 224 J5
IOPIN 1072 224 BiDir
FLAG 1072 288 S0
IOPIN 1072 288 BiDir
FLAG 1072 352 S0B
IOPIN 1072 352 BiDir
FLAG 1072 416 S1
IOPIN 1072 416 BiDir
FLAG 1072 480 S1B
IOPIN 1072 480 BiDir
FLAG 1072 544 S2
IOPIN 1072 544 BiDir
FLAG 1072 608 S2B
IOPIN 1072 608 BiDir
FLAG 1072 672 VDD
IOPIN 1072 672 BiDir
FLAG 1072 736 VSS
IOPIN 1072 736 BiDir
FLAG 1552 160 B4
IOPIN 1552 160 BiDir
FLAG 1072 1056 J5
IOPIN 1072 1056 BiDir
FLAG 1072 1120 J6
IOPIN 1072 1120 BiDir
FLAG 1072 1184 S0
IOPIN 1072 1184 BiDir
FLAG 1072 1248 S0B
IOPIN 1072 1248 BiDir
FLAG 1072 1312 S1
IOPIN 1072 1312 BiDir
FLAG 1072 1376 S1B
IOPIN 1072 1376 BiDir
FLAG 1072 1440 S2
IOPIN 1072 1440 BiDir
FLAG 1072 1504 S2B
IOPIN 1072 1504 BiDir
FLAG 1072 1568 VDD
IOPIN 1072 1568 BiDir
FLAG 1072 1632 VSS
IOPIN 1072 1632 BiDir
FLAG 1552 1056 B5
IOPIN 1552 1056 BiDir
FLAG 1072 1952 J6
IOPIN 1072 1952 BiDir
FLAG 1072 2016 J7
IOPIN 1072 2016 BiDir
FLAG 1072 2080 S0
IOPIN 1072 2080 BiDir
FLAG 1072 2144 S0B
IOPIN 1072 2144 BiDir
FLAG 1072 2208 S1
IOPIN 1072 2208 BiDir
FLAG 1072 2272 S1B
IOPIN 1072 2272 BiDir
FLAG 1072 2336 S2
IOPIN 1072 2336 BiDir
FLAG 1072 2400 S2B
IOPIN 1072 2400 BiDir
FLAG 1072 2464 VDD
IOPIN 1072 2464 BiDir
FLAG 1072 2528 VSS
IOPIN 1072 2528 BiDir
FLAG 1552 1952 B6
IOPIN 1552 1952 BiDir
FLAG 1072 2848 J7
IOPIN 1072 2848 BiDir
FLAG 1072 2912 VREFH
IOPIN 1072 2912 BiDir
FLAG 1072 2976 S0
IOPIN 1072 2976 BiDir
FLAG 1072 3040 S0B
IOPIN 1072 3040 BiDir
FLAG 1072 3104 S1
IOPIN 1072 3104 BiDir
FLAG 1072 3168 S1B
IOPIN 1072 3168 BiDir
FLAG 1072 3232 S2
IOPIN 1072 3232 BiDir
FLAG 1072 3296 S2B
IOPIN 1072 3296 BiDir
FLAG 1072 3360 VDD
IOPIN 1072 3360 BiDir
FLAG 1072 3424 VSS
IOPIN 1072 3424 BiDir
FLAG 1552 2848 B7
IOPIN 1552 2848 BiDir
FLAG 2064 1248 B0
IOPIN 2064 1248 BiDir
FLAG 2064 1312 B1
IOPIN 2064 1312 BiDir
FLAG 2064 1376 B2
IOPIN 2064 1376 BiDir
FLAG 2064 1440 B3
IOPIN 2064 1440 BiDir
FLAG 2064 1504 B4
IOPIN 2064 1504 BiDir
FLAG 2064 1568 B5
IOPIN 2064 1568 BiDir
FLAG 2064 1632 B6
IOPIN 2064 1632 BiDir
FLAG 2064 1696 B7
IOPIN 2064 1696 BiDir
FLAG 2064 1760 S3
IOPIN 2064 1760 BiDir
FLAG 2064 1824 S3B
IOPIN 2064 1824 BiDir
FLAG 2064 1888 S4
IOPIN 2064 1888 BiDir
FLAG 2064 1952 S4B
IOPIN 2064 1952 BiDir
FLAG 2064 2016 S5
IOPIN 2064 2016 BiDir
FLAG 2064 2080 S5B
IOPIN 2064 2080 BiDir
FLAG 2064 2144 VDD
IOPIN 2064 2144 BiDir
FLAG 2064 2208 VSS
IOPIN 2064 2208 BiDir
FLAG 2544 1248 TAP
IOPIN 2544 1248 BiDir
SYMBOL DAC_Bank8 192 96 R0
WINDOW 0 32 -24 Left 2
SYMATTR InstName XBANK0
SYMBOL DAC_Bank8 192 992 R0
WINDOW 0 32 -24 Left 2
SYMATTR InstName XBANK1
SYMBOL DAC_Bank8 192 1888 R0
WINDOW 0 32 -24 Left 2
SYMATTR InstName XBANK2
SYMBOL DAC_Bank8 192 2784 R0
WINDOW 0 32 -24 Left 2
SYMATTR InstName XBANK3
SYMBOL DAC_Bank8 1120 96 R0
WINDOW 0 32 -24 Left 2
SYMATTR InstName XBANK4
SYMBOL DAC_Bank8 1120 992 R0
WINDOW 0 32 -24 Left 2
SYMATTR InstName XBANK5
SYMBOL DAC_Bank8 1120 1888 R0
WINDOW 0 32 -24 Left 2
SYMATTR InstName XBANK6
SYMBOL DAC_Bank8 1120 2784 R0
WINDOW 0 32 -24 Left 2
SYMATTR InstName XBANK7
SYMBOL DAC_Mux8 2112 1184 R0
WINDOW 0 32 -24 Left 2
SYMATTR InstName XBANKSEL

dac_bank8.asc, the sub-circuit schematic file:
Version 4.1
SHEET 1 2512 1664
WIRE 160 224 160 320
WIRE 240 224 432 224
WIRE 432 224 432 320
WIRE 512 224 704 224
WIRE 704 224 704 320
WIRE 784 224 976 224
WIRE 976 224 976 320
WIRE 1056 224 1248 224
WIRE 1248 224 1248 320
WIRE 1328 224 1520 224
WIRE 1520 224 1520 320
WIRE 1600 224 1792 224
WIRE 1792 224 1792 320
WIRE 1872 224 2064 224
WIRE 2064 224 2064 320
WIRE 2144 224 2336 224
WIRE 2336 224 2336 320
WIRE 960 544 912 544
WIRE 960 608 912 608
WIRE 960 672 912 672
WIRE 960 736 912 736
WIRE 960 800 912 800
WIRE 960 864 912 864
WIRE 960 928 912 928
WIRE 960 992 912 992
WIRE 960 1056 912 1056
WIRE 960 1120 912 1120
WIRE 960 1184 912 1184
WIRE 960 1248 912 1248
WIRE 960 1312 912 1312
WIRE 960 1376 912 1376
WIRE 960 1440 912 1440
WIRE 960 1504 912 1504
WIRE 1344 544 1392 544
FLAG 160 320 LO
IOPIN 160 320 BiDir
FLAG 432 320 T1
IOPIN 432 320 BiDir
FLAG 704 320 T2
IOPIN 704 320 BiDir
FLAG 976 320 T3
IOPIN 976 320 BiDir
FLAG 1248 320 T4
IOPIN 1248 320 BiDir
FLAG 1520 320 T5
IOPIN 1520 320 BiDir
FLAG 1792 320 T6
IOPIN 1792 320 BiDir
FLAG 2064 320 T7
IOPIN 2064 320 BiDir
FLAG 2336 320 HI
IOPIN 2336 320 BiDir
FLAG 912 544 LO
IOPIN 912 544 BiDir
FLAG 912 608 T1
IOPIN 912 608 BiDir
FLAG 912 672 T2
IOPIN 912 672 BiDir
FLAG 912 736 T3
IOPIN 912 736 BiDir
FLAG 912 800 T4
IOPIN 912 800 BiDir
FLAG 912 864 T5
IOPIN 912 864 BiDir
FLAG 912 928 T6
IOPIN 912 928 BiDir
FLAG 912 992 T7
IOPIN 912 992 BiDir
FLAG 912 1056 S0
IOPIN 912 1056 BiDir
FLAG 912 1120 S0B
IOPIN 912 1120 BiDir
FLAG 912 1184 S1
IOPIN 912 1184 BiDir
FLAG 912 1248 S1B
IOPIN 912 1248 BiDir
FLAG 912 1312 S2
IOPIN 912 1312 BiDir
FLAG 912 1376 S2B
IOPIN 912 1376 BiDir
FLAG 912 1440 VDD
IOPIN 912 1440 BiDir
FLAG 912 1504 VSS
IOPIN 912 1504 BiDir
FLAG 1392 544 Y
IOPIN 1392 544 BiDir
SYMBOL res 256 208 R90
WINDOW 0 -16 76 Left 2
WINDOW 3 80 76 Left 2
SYMATTR InstName R1
SYMATTR Value 1k
SYMBOL res 528 208 R90
WINDOW 0 -16 76 Left 2
WINDOW 3 80 76 Left 2
SYMATTR InstName R2
SYMATTR Value 1k
SYMBOL res 800 208 R90
WINDOW 0 -16 76 Left 2
WINDOW 3 80 76 Left 2
SYMATTR InstName R3
SYMATTR Value 1k
SYMBOL res 1072 208 R90
WINDOW 0 -16 76 Left 2
WINDOW 3 80 76 Left 2
SYMATTR InstName R4
SYMATTR Value 1k
SYMBOL res 1344 208 R90
WINDOW 0 -16 76 Left 2
WINDOW 3 80 76 Left 2
SYMATTR InstName R5
SYMATTR Value 1k
SYMBOL res 1616 208 R90
WINDOW 0 -16 76 Left 2
WINDOW 3 80 76 Left 2
SYMATTR InstName R6
SYMATTR Value 1k
SYMBOL res 1888 208 R90
WINDOW 0 -16 76 Left 2
WINDOW 3 80 76 Left 2
SYMATTR InstName R7
SYMATTR Value 1k
SYMBOL res 2160 208 R90
WINDOW 0 -16 76 Left 2
WINDOW 3 80 76 Left 2
SYMATTR InstName R8
SYMATTR Value 1k
SYMBOL DAC_Mux8 960 480 R0
WINDOW 0 32 -24 Left 2
SYMATTR InstName XSELECT

dac_mux8.asc, the sub-circuit schematic file:
Version 4.1
SHEET 1 2112 2448
WIRE 192 160 144 160
WIRE 192 224 144 224
WIRE 192 288 144 288
WIRE 192 352 144 352
WIRE 192 416 144 416
WIRE 192 480 144 480
WIRE 576 160 624 160
WIRE 192 720 144 720
WIRE 192 784 144 784
WIRE 192 848 144 848
WIRE 192 912 144 912
WIRE 192 976 144 976
WIRE 192 1040 144 1040
WIRE 576 720 624 720
WIRE 192 1280 144 1280
WIRE 192 1344 144 1344
WIRE 192 1408 144 1408
WIRE 192 1472 144 1472
WIRE 192 1536 144 1536
WIRE 192 1600 144 1600
WIRE 576 1280 624 1280
WIRE 192 1840 144 1840
WIRE 192 1904 144 1904
WIRE 192 1968 144 1968
WIRE 192 2032 144 2032
WIRE 192 2096 144 2096
WIRE 192 2160 144 2160
WIRE 576 1840 624 1840
WIRE 848 440 800 440
WIRE 848 504 800 504
WIRE 848 568 800 568
WIRE 848 632 800 632
WIRE 848 696 800 696
WIRE 848 760 800 760
WIRE 1232 440 1280 440
WIRE 848 1560 800 1560
WIRE 848 1624 800 1624
WIRE 848 1688 800 1688
WIRE 848 1752 800 1752
WIRE 848 1816 800 1816
WIRE 848 1880 800 1880
WIRE 1232 1560 1280 1560
WIRE 1504 1000 1456 1000
WIRE 1504 1064 1456 1064
WIRE 1504 1128 1456 1128
WIRE 1504 1192 1456 1192
WIRE 1504 1256 1456 1256
WIRE 1504 1320 1456 1320
WIRE 1888 1000 1936 1000
FLAG 144 160 I0
IOPIN 144 160 BiDir
FLAG 144 224 I1
IOPIN 144 224 BiDir
FLAG 144 288 S0
IOPIN 144 288 BiDir
FLAG 144 352 S0B
IOPIN 144 352 BiDir
FLAG 144 416 VDD
IOPIN 144 416 BiDir
FLAG 144 480 VSS
IOPIN 144 480 BiDir
FLAG 624 160 N0_0
IOPIN 624 160 BiDir
FLAG 144 720 I2
IOPIN 144 720 BiDir
FLAG 144 784 I3
IOPIN 144 784 BiDir
FLAG 144 848 S0
IOPIN 144 848 BiDir
FLAG 144 912 S0B
IOPIN 144 912 BiDir
FLAG 144 976 VDD
IOPIN 144 976 BiDir
FLAG 144 1040 VSS
IOPIN 144 1040 BiDir
FLAG 624 720 N0_1
IOPIN 624 720 BiDir
FLAG 144 1280 I4
IOPIN 144 1280 BiDir
FLAG 144 1344 I5
IOPIN 144 1344 BiDir
FLAG 144 1408 S0
IOPIN 144 1408 BiDir
FLAG 144 1472 S0B
IOPIN 144 1472 BiDir
FLAG 144 1536 VDD
IOPIN 144 1536 BiDir
FLAG 144 1600 VSS
IOPIN 144 1600 BiDir
FLAG 624 1280 N0_2
IOPIN 624 1280 BiDir
FLAG 144 1840 I6
IOPIN 144 1840 BiDir
FLAG 144 1904 I7
IOPIN 144 1904 BiDir
FLAG 144 1968 S0
IOPIN 144 1968 BiDir
FLAG 144 2032 S0B
IOPIN 144 2032 BiDir
FLAG 144 2096 VDD
IOPIN 144 2096 BiDir
FLAG 144 2160 VSS
IOPIN 144 2160 BiDir
FLAG 624 1840 N0_3
IOPIN 624 1840 BiDir
FLAG 800 440 N0_0
IOPIN 800 440 BiDir
FLAG 800 504 N0_1
IOPIN 800 504 BiDir
FLAG 800 568 S1
IOPIN 800 568 BiDir
FLAG 800 632 S1B
IOPIN 800 632 BiDir
FLAG 800 696 VDD
IOPIN 800 696 BiDir
FLAG 800 760 VSS
IOPIN 800 760 BiDir
FLAG 1280 440 N1_0
IOPIN 1280 440 BiDir
FLAG 800 1560 N0_2
IOPIN 800 1560 BiDir
FLAG 800 1624 N0_3
IOPIN 800 1624 BiDir
FLAG 800 1688 S1
IOPIN 800 1688 BiDir
FLAG 800 1752 S1B
IOPIN 800 1752 BiDir
FLAG 800 1816 VDD
IOPIN 800 1816 BiDir
FLAG 800 1880 VSS
IOPIN 800 1880 BiDir
FLAG 1280 1560 N1_1
IOPIN 1280 1560 BiDir
FLAG 1456 1000 N1_0
IOPIN 1456 1000 BiDir
FLAG 1456 1064 N1_1
IOPIN 1456 1064 BiDir
FLAG 1456 1128 S2
IOPIN 1456 1128 BiDir
FLAG 1456 1192 S2B
IOPIN 1456 1192 BiDir
FLAG 1456 1256 VDD
IOPIN 1456 1256 BiDir
FLAG 1456 1320 VSS
IOPIN 1456 1320 BiDir
FLAG 1936 1000 Y
IOPIN 1936 1000 BiDir
SYMBOL DAC_Mux2 192 96 R0
WINDOW 0 32 -24 Left 2
SYMATTR InstName XM0_0
SYMBOL DAC_Mux2 192 656 R0
WINDOW 0 32 -24 Left 2
SYMATTR InstName XM0_1
SYMBOL DAC_Mux2 192 1216 R0
WINDOW 0 32 -24 Left 2
SYMATTR InstName XM0_2
SYMBOL DAC_Mux2 192 1776 R0
WINDOW 0 32 -24 Left 2
SYMATTR InstName XM0_3
SYMBOL DAC_Mux2 848 376 R0
WINDOW 0 32 -24 Left 2
SYMATTR InstName XM1_0
SYMBOL DAC_Mux2 848 1496 R0
WINDOW 0 32 -24 Left 2
SYMATTR InstName XM1_1
SYMBOL DAC_Mux2 1504 936 R0
WINDOW 0 32 -24 Left 2
SYMATTR InstName XM2_0

dac_mux2.asc, the sub-circuit schematic file:
Version 4.1
SHEET 1 1344 1008
WIRE 352 224 288 224
WIRE 672 224 736 224
WIRE 464 128 464 64
WIRE 560 128 560 64
WIRE 464 352 464 416
WIRE 560 352 560 416
WIRE 352 640 288 640
WIRE 672 640 736 640
WIRE 464 544 464 480
WIRE 560 544 560 480
WIRE 464 768 464 832
WIRE 560 768 560 832
FLAG 288 224 A
IOPIN 288 224 BiDir
FLAG 736 224 Y
IOPIN 736 224 BiDir
FLAG 464 64 VDD
IOPIN 464 64 BiDir
FLAG 560 64 VSS
IOPIN 560 64 BiDir
FLAG 464 416 SB
IOPIN 464 416 BiDir
FLAG 560 416 S
IOPIN 560 416 BiDir
FLAG 288 640 B
IOPIN 288 640 BiDir
FLAG 736 640 Y
IOPIN 736 640 BiDir
FLAG 464 480 VDD
IOPIN 464 480 BiDir
FLAG 560 480 VSS
IOPIN 560 480 BiDir
FLAG 464 832 S
IOPIN 464 832 BiDir
FLAG 560 832 SB
IOPIN 560 832 BiDir
SYMBOL CMOS_TG 352 128 R0
WINDOW 0 32 -24 Left 2
SYMATTR InstName XTG0
SYMBOL CMOS_TG 352 544 R0
WINDOW 0 32 -24 Left 2
SYMATTR InstName XTG1

cmos_tg.asc, the sub-circuit schematic file:
Version 4.1
SHEET 1 896 640
WIRE 304 192 400 192
WIRE 496 192 592 192
WIRE 416 144 416 80
WIRE 448 192 448 240
WIRE 304 416 400 416
WIRE 496 416 592 416
WIRE 416 368 416 304
WIRE 448 416 448 464
WIRE 304 192 304 304
WIRE 304 304 304 416
WIRE 128 304 304 304
WIRE 592 192 592 304
WIRE 592 304 592 416
WIRE 592 304 784 304
FLAG 416 80 EN
IOPIN 416 80 In
FLAG 448 240 VSS
IOPIN 448 240 In
FLAG 416 304 ENB
IOPIN 416 304 In
FLAG 448 464 VDD
IOPIN 448 464 In
FLAG 128 304 IN
IOPIN 128 304 BiDir
FLAG 784 304 OUT
IOPIN 784 304 BiDir
SYMBOL nmos4 496 144 R90
WINDOW 0 -16 -16 Left 2
WINDOW 3 16 -16 Left 2
SYMATTR InstName MN
SYMATTR Value NMOD
SYMATTR SpiceLine W=100u L=1u
SYMBOL pmos4 496 368 R90
WINDOW 0 -16 -16 Left 2
WINDOW 3 16 -16 Left 2
SYMATTR InstName MP
SYMATTR Value PMOD
SYMATTR SpiceLine W=200u L=1u

dac_buffer.asc, the sub-circuit schematic file:
Version 4.1
SHEET 1 1152 768
WIRE 480 336 288 336
WIRE 480 368 384 368
WIRE 384 368 384 560
WIRE 384 560 528 560
WIRE 608 384 800 384
WIRE 800 384 960 384
WIRE 800 384 800 560
WIRE 608 560 800 560
WIRE 608 320 608 128
WIRE 608 352 672 352
FLAG 288 336 IN
IOPIN 288 336 In
FLAG 960 384 OUT
IOPIN 960 384 Out
FLAG 608 128 VDDA
IOPIN 608 128 In
FLAG 672 352 VSS
IOPIN 672 352 In
SYMBOL MCP6001 544 352 R0
WINDOW 0 -16 -96 Left 2
WINDOW 3 -64 96 Left 2
SYMATTR InstName U1
SYMATTR Value MCP6001
SYMBOL res 624 544 R90
WINDOW 0 -16 80 Left 2
WINDOW 3 80 80 Left 2
SYMATTR InstName RF
SYMATTR Value 1k

The netlist it stands for:
* DAC6_Heavy_Load.asc
X§XCONTROL D0 D1 D2 D3 D4 D5 EN VDDL VDDA 0 S0 S0B S1 S1B S2 S2B S3 S3B S4 S4B S5 S5B E EB dac_control
X§XSTRING VREFL VREFH S0 S0B S1 S1B S2 S2B S3 S3B S4 S4B S5 S5B VDDA 0 TAP dac_string64
X§XENABLE VREFL TAP E EB VDDA 0 DAC_IN dac_mux2
X§XBUFFER DAC_IN VDDA 0 OUT dac_buffer
VDD VDDA 0 3.3
VLOGIC VDDL 0 1.8
VHIGH VREFH 0 3.0
VLOW VREFL 0 0.3
CDEC VDDA 0 100n
VD0 D0 0 PWL FILE="data_d0.txt"
VD1 D1 0 PWL FILE="data_d1.txt"
VD2 D2 0 PWL FILE="data_d2.txt"
VD3 D3 0 PWL FILE="data_d3.txt"
VD4 D4 0 PWL FILE="data_d4.txt"
VD5 D5 0 PWL FILE="data_d5.txt"
VEN EN 0 PWL FILE="enable.txt"
RLOAD OUT 0 1k
CLOAD OUT 0 20p

* block symbol definitions
.subckt dac_control D0 D1 D2 D3 D4 D5 EN VDDL VDDA VSS S0 S0B S1 S1B S2 S2B S3 S3B S4 S4B S5 S5B E EB
X§XLS0 D0 VDDL VDDA VSS S0 S0B dac_levelshift
X§XLS1 D1 VDDL VDDA VSS S1 S1B dac_levelshift
X§XLS2 D2 VDDL VDDA VSS S2 S2B dac_levelshift
X§XLS3 D3 VDDL VDDA VSS S3 S3B dac_levelshift
X§XLS4 D4 VDDL VDDA VSS S4 S4B dac_levelshift
X§XLS5 D5 VDDL VDDA VSS S5 S5B dac_levelshift
X§XLS6 EN VDDL VDDA VSS E EB dac_levelshift
.ends dac_control

.subckt dac_levelshift D VDDL VDDA VSS Q QB
X§XINV D DB VDDL VSS cmos_inv
MPA QB Q VDDA VDDA PMOD W=4u L=1u
MNA QB D VSS VSS NMOD W=40u L=1u
MPB Q QB VDDA VDDA PMOD W=4u L=1u
MNB Q DB VSS VSS NMOD W=40u L=1u
.ends dac_levelshift

.subckt cmos_inv A Z VDD VSS
MP Z A VDD VDD PMOD W=20u L=1u
MN Z A VSS VSS NMOD W=10u L=1u
.ends cmos_inv

.subckt dac_string64 VREFL VREFH S0 S0B S1 S1B S2 S2B S3 S3B S4 S4B S5 S5B VDD VSS TAP
X§XBANK0 VREFL J1 S0 S0B S1 S1B S2 S2B VDD VSS B0 dac_bank8
X§XBANK1 J1 J2 S0 S0B S1 S1B S2 S2B VDD VSS B1 dac_bank8
X§XBANK2 J2 J3 S0 S0B S1 S1B S2 S2B VDD VSS B2 dac_bank8
X§XBANK3 J3 J4 S0 S0B S1 S1B S2 S2B VDD VSS B3 dac_bank8
X§XBANK4 J4 J5 S0 S0B S1 S1B S2 S2B VDD VSS B4 dac_bank8
X§XBANK5 J5 J6 S0 S0B S1 S1B S2 S2B VDD VSS B5 dac_bank8
X§XBANK6 J6 J7 S0 S0B S1 S1B S2 S2B VDD VSS B6 dac_bank8
X§XBANK7 J7 VREFH S0 S0B S1 S1B S2 S2B VDD VSS B7 dac_bank8
X§XBANKSEL B0 B1 B2 B3 B4 B5 B6 B7 S3 S3B S4 S4B S5 S5B VDD VSS TAP dac_mux8
.ends dac_string64

.subckt dac_bank8 LO HI S0 S0B S1 S1B S2 S2B VDD VSS Y
R1 T1 LO 1k
R2 T2 T1 1k
R3 T3 T2 1k
R4 T4 T3 1k
R5 T5 T4 1k
R6 T6 T5 1k
R7 T7 T6 1k
R8 HI T7 1k
X§XSELECT LO T1 T2 T3 T4 T5 T6 T7 S0 S0B S1 S1B S2 S2B VDD VSS Y dac_mux8
.ends dac_bank8

.subckt dac_mux8 I0 I1 I2 I3 I4 I5 I6 I7 S0 S0B S1 S1B S2 S2B VDD VSS Y
X§XM0_0 I0 I1 S0 S0B VDD VSS N0_0 dac_mux2
X§XM0_1 I2 I3 S0 S0B VDD VSS N0_1 dac_mux2
X§XM0_2 I4 I5 S0 S0B VDD VSS N0_2 dac_mux2
X§XM0_3 I6 I7 S0 S0B VDD VSS N0_3 dac_mux2
X§XM1_0 N0_0 N0_1 S1 S1B VDD VSS N1_0 dac_mux2
X§XM1_1 N0_2 N0_3 S1 S1B VDD VSS N1_1 dac_mux2
X§XM2_0 N1_0 N1_1 S2 S2B VDD VSS Y dac_mux2
.ends dac_mux8

.subckt dac_mux2 A B S SB VDD VSS Y
X§XTG0 A Y SB S VDD VSS cmos_tg
X§XTG1 B Y S SB VDD VSS cmos_tg
.ends dac_mux2

.subckt cmos_tg IN OUT EN ENB VDD VSS
MN OUT EN IN VSS NMOD W=100u L=1u
MP OUT ENB IN VDD PMOD W=200u L=1u
.ends cmos_tg

.subckt dac_buffer IN VDDA VSS OUT
X§U1 IN N001 VDDA VSS OUT MCP6001  ; pins in+ in- V+ V- out
RF OUT N001 1k
.ends dac_buffer

.model NMOS NMOS
.model PMOS PMOS
.lib standard.mos
.include DAC6_Models.lib
.tran 0 8m 0 1u
.options plotwinsize=0 method=gear
.save V(*) V(*:*) V(*:*:*) V(*:*:*:*) V(*:*:*:*:*) I(VHIGH) I(VLOW) I(VDD) I(VLOGIC)
.meas tran OUT63 FIND V(OUT) AT=6.35m
.meas tran OUT0 FIND V(OUT) AT=50u
.lib MCP6001.txt
.backanno
.end